# Altium project Servo-Board-v1.0.PrjPcb (part 9 of 23)

## Sheet Sec_Controller_Sheet4.SchDoc
size 420 x 297 mm; SheetNumber: 23; SheetTotal: 26
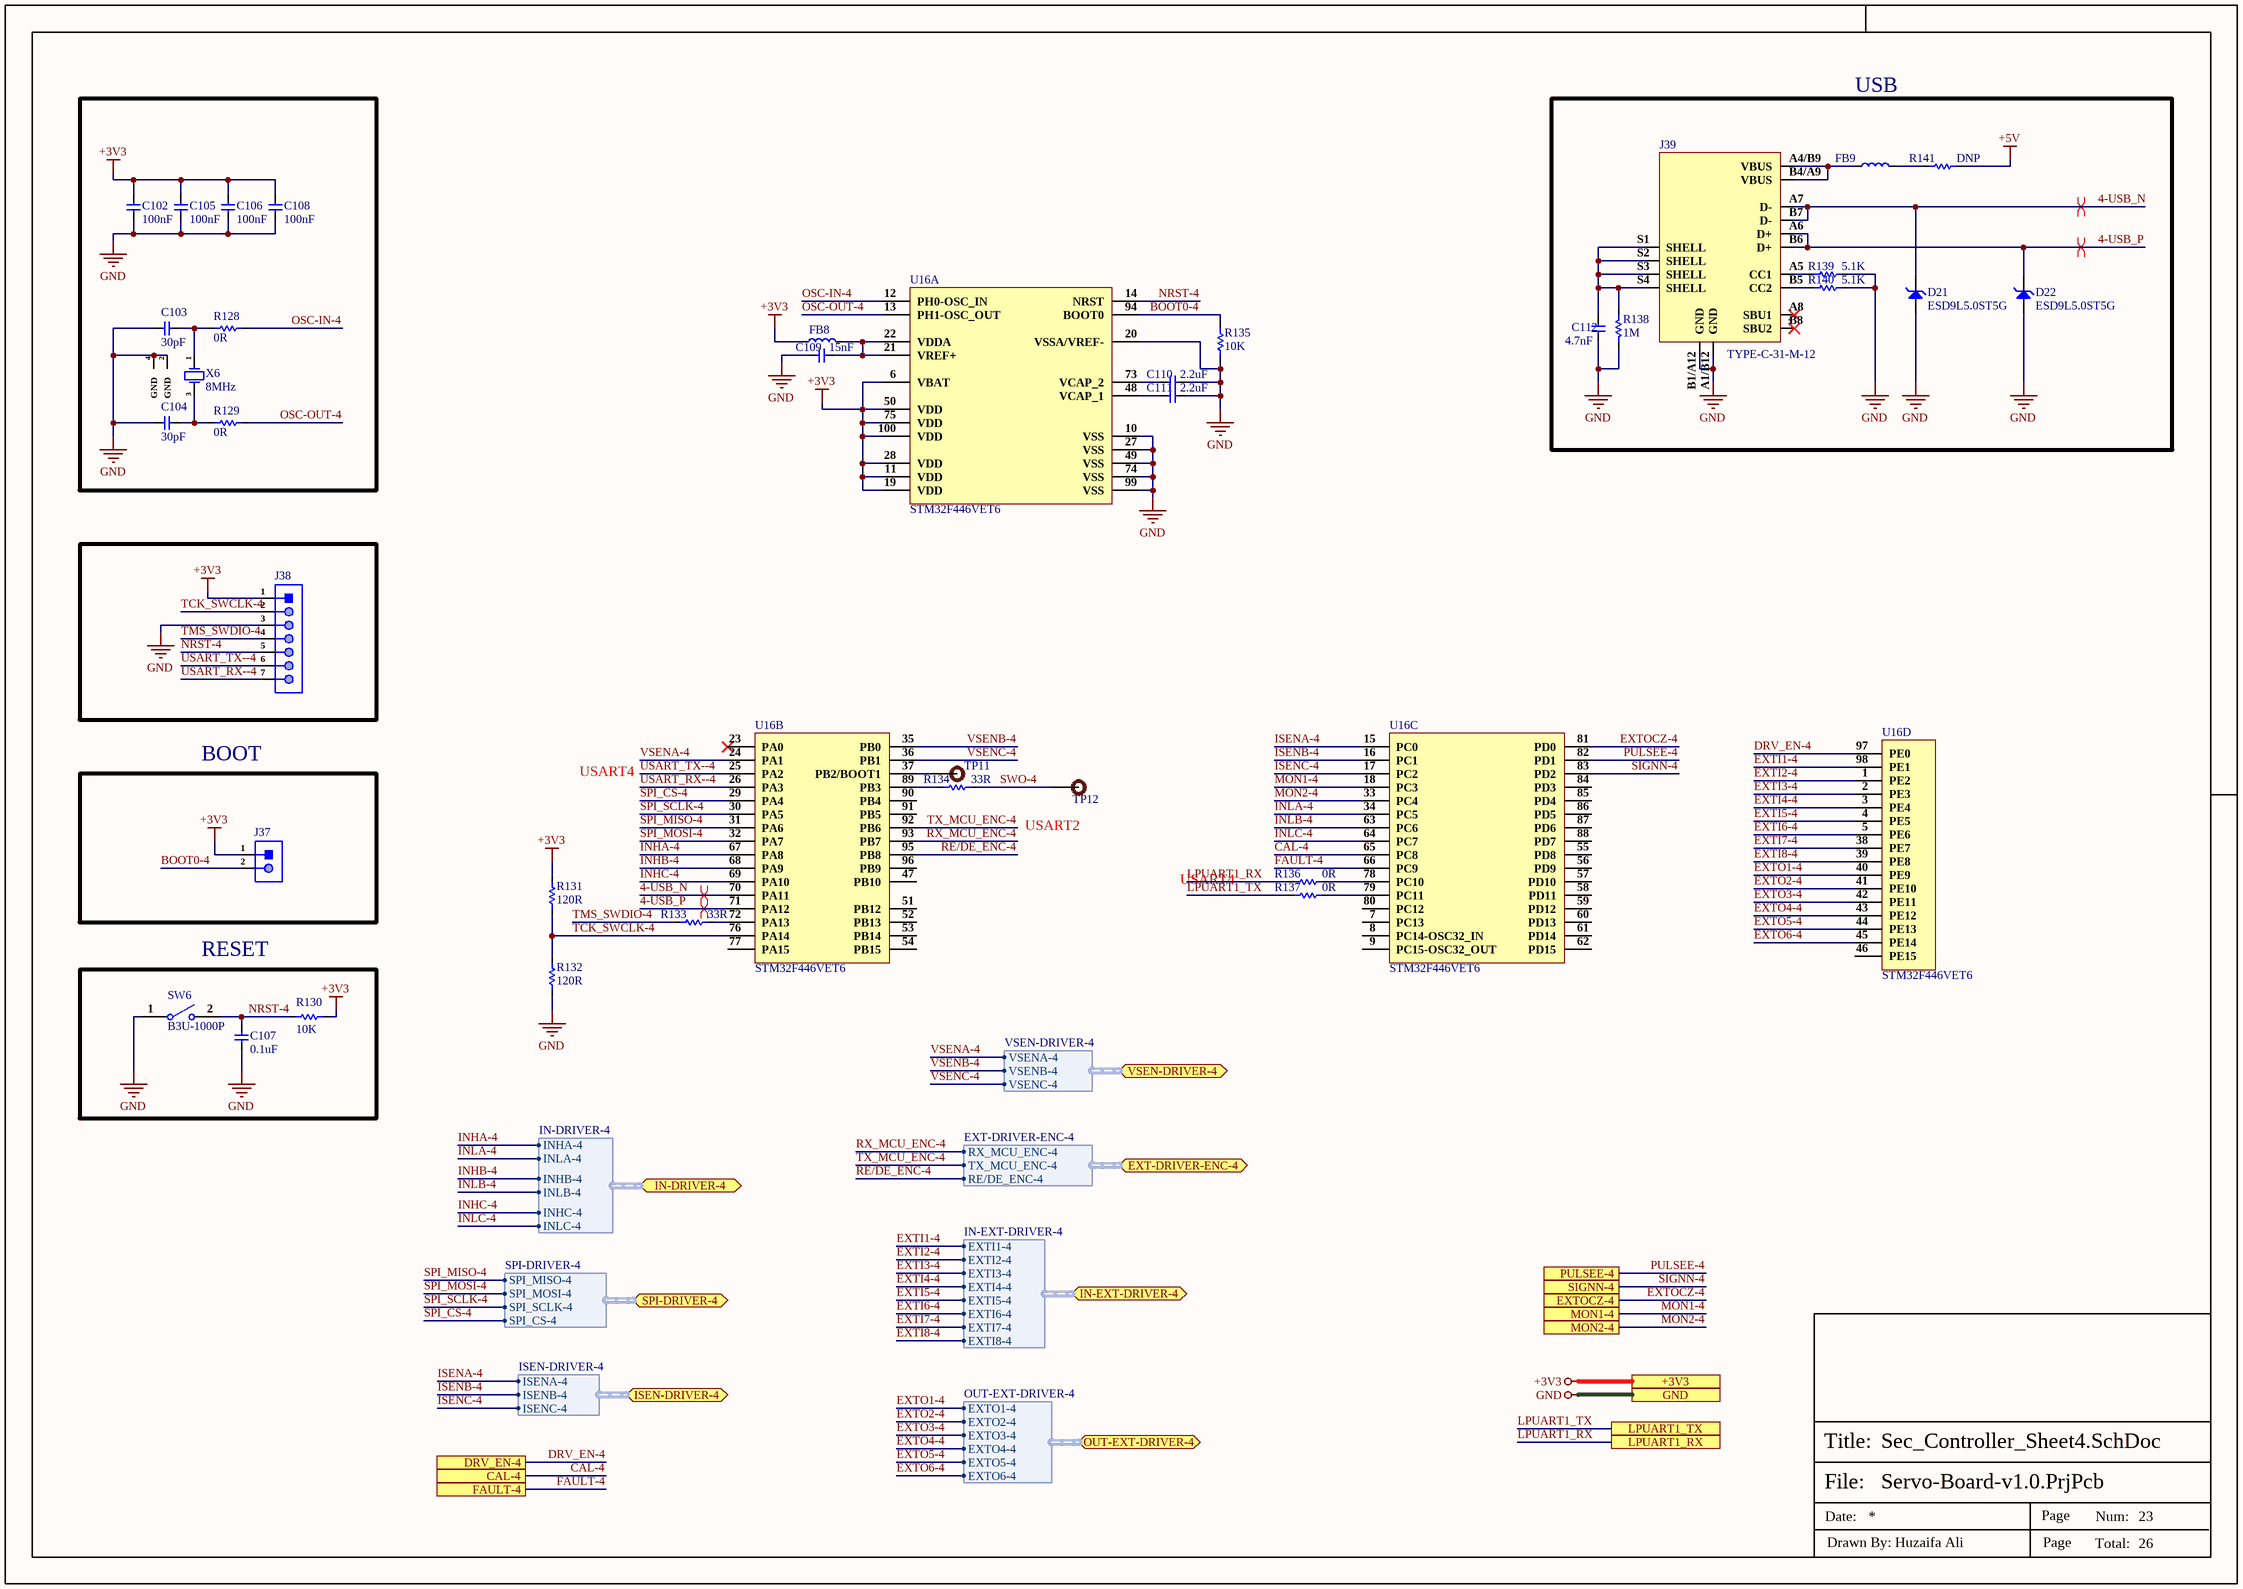
[diagram p11: Sec_Controller_Sheet4.SchDoc]

### Parts
C102  100nF  [cap-0402]
C103  30pF  [Cap-0402]
C104  30pF  [Cap-0402]
C105  100nF  [cap-0402]
C106  100nF  [cap-0402]
C107  0.1uF  [Cap-0402]
C108  100nF  [cap-0402]
C109  15nF  [Cap-0402]
C110  2.2uF  [Cap-0402]
C111  2.2uF  [Cap-0402]
C112  4.7nF  [Cap-0603]
D21  ESD9L5.0ST5G  [SOD-923.]
D22  ESD9L5.0ST5G  [SOD-923.]
FB8  BLM18PG221SN1D  [IND-0603 (1608 Metric)]  (value not drawn)
FB9  BLM18PG221SN1D  [IND-0603 (1608 Metric)]  (value not drawn)
J37  X6511WV-02H-C60D30  [HDR1X2_]  (value not drawn)
J38  X6511WV-07H-C60D30  [HDR1X7]  (value not drawn)
J39  TYPE-C-31-M-12  [TYPE-C-31-M-12_]
R128  0R  [Res-0603]
R129  0R  [Res-0603]
R130  10K  [Res-0402]
R131  120R  [Res-0402]
R132  120R  [Res-0402]
R133  33R  [Res-0402]
R134  33R  [Res-0402]
R135  10K  [Res-0402]
R136  0R  [Res-0402]
R137  0R  [Res-0402]
R138  1M  [Res-0402]
R139  5.1K  [Res-0402]
R140  5.1K  [Res-0402]
R141  DNP  [Res-0402]
SW6  B3U-1000P  [B3U-1000P]
TP11  TEST POINT 0.5mm Dia  [Test-point - 0.5mm]  (value not drawn)  (no BOM)
TP12  TEST POINT 0.5mm Dia  [Test-point - 0.5mm]  (value not drawn)  (no BOM)
U16  STM32F446VET6  [LQFP-100]  (parts A,B,C,D of 4)
X6  8MHz  [5TJ480000XYLBC_]

### Blocks framed on the sheet
USB: C112 D21 D22 FB9 J39 R138-R141
BOOT: J37
RESET: C107 R130 SW6

### Ports
+3V3 (see Servo4[3A], CAN_Sheet[4D], Controller_Sheet[5D], DIO_1[5D], DIO_2[5D], DIO_3[5D], DIO_4[5D], Encoder_Sheet1[5D], Encoder_Sheet2[4D], Encoder_Sheet3[4D], Encoder_Sheet4[5D], EtherCAT_Sheet[5D], Motor_Driver_Sheet1[5D], Motor_Driver_Sheet2[5D], Motor_Driver_Sheet3[5D], Motor_Driver_Sheet4[5D], Power_Sheet[5D], RS485_RS232_Sheet[5D], Sec_Controller_Sheet1[5D], Sec_Controller_Sheet2[5D], Sec_Controller_Sheet3[5D], Servo1[5D], Servo2[5D], Servo3[5D], Servo4[5D]), CAL-4 (see Servo4[3B], Motor_Driver_Sheet4[1D]), DRV_EN-4 (see Servo4[3B], Motor_Driver_Sheet4[1D]), EXT-DRIVER-ENC-4 (bidir, harness EXT-DRIVER-ENC-4, see Servo4[4B], Encoder_Sheet4[3D]), EXTOCZ-4 (see Servo4[4B], DIO_4[3D]), FAULT-4 (see Servo4[3B], Motor_Driver_Sheet4[1D]), GND (see Servo4[3B], CAN_Sheet[4D], Controller_Sheet[5D], DIO_1[5D], DIO_2[5D], DIO_3[5D], DIO_4[5D], Encoder_Sheet1[5D], Encoder_Sheet2[4D], Encoder_Sheet3[4D], Encoder_Sheet4[5D], EtherCAT_Sheet[5D], Motor_Driver_Sheet1[5D], Motor_Driver_Sheet2[5D], Motor_Driver_Sheet3[5D], Motor_Driver_Sheet4[5D], Power_Sheet[5D], RS485_RS232_Sheet[5D], Sec_Controller_Sheet1[5D], Sec_Controller_Sheet2[5D], Sec_Controller_Sheet3[5D], Servo1[5D], Servo2[5D], Servo3[5D], Servo4[5D]), IN-DRIVER-4 (bidir, harness IN-DRIVER-4, see Servo4[3B], Motor_Driver_Sheet4[1D]), IN-EXT-DRIVER-4 (bidir, harness IN-EXT-DRIVER-4, see Servo4[4B], DIO_4[1D]), ISEN-DRIVER-4 (bidir, harness ISEN-DRIVER-4, see Servo4[3B], Motor_Driver_Sheet4[3D]), LPUART1_RX (see Servo4[3B], Controller_Sheet[4D], Servo4[3B]), LPUART1_TX (see Servo4[3B], Controller_Sheet[4D], Servo4[3B]), MON1-4 (see Servo4[4B], DIO_4[3D]), MON2-4 (see Servo4[4B], DIO_4[3D]), OUT-EXT-DRIVER-4 (bidir, harness OUT-EXT-DRIVER-4, see Servo4[4B], DIO_4[2D]), PULSEE-4 (see Servo4[4B], DIO_4[3D]), SIGNN-4 (see Servo4[4B], DIO_4[3D]), SPI-DRIVER-4 (bidir, harness SPI-DRIVER-4, see Servo4[3B], Motor_Driver_Sheet4[2D]), VSEN-DRIVER-4 (bidir, harness VSEN-DRIVER-4, see Servo4[3B], Motor_Driver_Sheet4[4D])

### Harnesses
IN-DRIVER-4: INHA-4, INLA-4, INHB-4, INLB-4, INHC-4, INLC-4
SPI-DRIVER-4: SPI_MISO-4, SPI_MOSI-4, SPI_SCLK-4, SPI_CS-4
ISEN-DRIVER-4: ISENA-4, ISENB-4, ISENC-4
EXT-DRIVER-ENC-4: RX_MCU_ENC-4, TX_MCU_ENC-4, RE/DE_ENC-4
IN-EXT-DRIVER-4: EXTI1-4, EXTI2-4, EXTI3-4, EXTI4-4, EXTI5-4, EXTI6-4, EXTI7-4, EXTI8-4
OUT-EXT-DRIVER-4: EXTO1-4, EXTO2-4, EXTO3-4, EXTO4-4, EXTO5-4, EXTO6-4
VSEN-DRIVER-4: VSENA-4, VSENB-4, VSENC-4

### Nets
+3V3: C102.2 C105.2 C106.2 C108.2 FB8.1 J37.1 J38.1 R130.2 R131.2 U16.6(VBAT) U16.11(VDD) U16.19(VDD) U16.28(VDD) U16.50(VDD) U16.75(VDD) U16.100(VDD) ; port +3V3
+5V: R141.2
GND: C102.1 C103.1 C104.1 C105.1 C106.1 C107.1 C108.1 C109.1 C110.2 C111.2 C112.1 D21.2(A) D22.2(A) J38.3 J39.A1/B12(GND) J39.B1/A12(GND) R132.1 R135.1 R138.2 R139.2 R140.2 SW6.1 U16.10(VSS) U16.20(VSSA/VREF-) U16.27(VSS) U16.49(VSS) U16.74(VSS) U16.99(VSS) X6.2(GND) X6.4(GND) ; port GND
4-USB_N: D21.1(K) J39.A7(D-) J39.B7(D-) U16.70(PA11)
4-USB_P: D22.1(K) J39.A6(D+) J39.B6(D+) U16.71(PA12)
BOOT0-4: J37.2 R135.2 U16.94(BOOT0)
CAL-4: U16.65(PC8) ; port CAL-4
DRV_EN-4: U16.97(PE0) ; port DRV_EN-4
EXTI1-4: U16.98(PE1) ; port IN-EXT-DRIVER-4.EXTI1-4
EXTI2-4: U16.1(PE2) ; port IN-EXT-DRIVER-4.EXTI2-4
EXTI3-4: U16.2(PE3) ; port IN-EXT-DRIVER-4.EXTI3-4
EXTI4-4: U16.3(PE4) ; port IN-EXT-DRIVER-4.EXTI4-4
EXTI5-4: U16.4(PE5) ; port IN-EXT-DRIVER-4.EXTI5-4
EXTI6-4: U16.5(PE6) ; port IN-EXT-DRIVER-4.EXTI6-4
EXTI7-4: U16.38(PE7) ; port IN-EXT-DRIVER-4.EXTI7-4
EXTI8-4: U16.39(PE8) ; port IN-EXT-DRIVER-4.EXTI8-4
EXTO1-4: U16.40(PE9) ; port OUT-EXT-DRIVER-4.EXTO1-4
EXTO2-4: U16.41(PE10) ; port OUT-EXT-DRIVER-4.EXTO2-4
EXTO3-4: U16.42(PE11) ; port OUT-EXT-DRIVER-4.EXTO3-4
EXTO4-4: U16.43(PE12) ; port OUT-EXT-DRIVER-4.EXTO4-4
EXTO5-4: U16.44(PE13) ; port OUT-EXT-DRIVER-4.EXTO5-4
EXTO6-4: U16.45(PE14) ; port OUT-EXT-DRIVER-4.EXTO6-4
EXTOCZ-4: U16.81(PD0) ; port EXTOCZ-4
FAULT-4: U16.66(PC9) ; port FAULT-4
INHA-4: U16.67(PA8) ; port IN-DRIVER-4.INHA-4
INHB-4: U16.68(PA9) ; port IN-DRIVER-4.INHB-4
INHC-4: U16.69(PA10) ; port IN-DRIVER-4.INHC-4
INLA-4: U16.34(PC5) ; port IN-DRIVER-4.INLA-4
INLB-4: U16.63(PC6) ; port IN-DRIVER-4.INLB-4
INLC-4: U16.64(PC7) ; port IN-DRIVER-4.INLC-4
ISENA-4: U16.15(PC0) ; port ISEN-DRIVER-4.ISENA-4
ISENB-4: U16.16(PC1) ; port ISEN-DRIVER-4.ISENB-4
ISENC-4: U16.17(PC2) ; port ISEN-DRIVER-4.ISENC-4
LPUART1_RX: R136.1 ; port LPUART1_RX
LPUART1_TX: R137.1 ; port LPUART1_TX
MON1-4: U16.18(PC3) ; port MON1-4
MON2-4: U16.33(PC4) ; port MON2-4
NRST-4: C107.2 J38.5 R130.1 SW6.2 U16.14(NRST)
OSC-IN-4: R128.2 U16.12(PH0-OSC_IN)
OSC-OUT-4: R129.2 U16.13(PH1-OSC_OUT)
PULSEE-4: U16.82(PD1) ; port PULSEE-4
RE/DE_ENC-4: U16.95(PB8) ; port EXT-DRIVER-ENC-4.RE/DE_ENC-4
RX_MCU_ENC-4: U16.93(PB7) ; port EXT-DRIVER-ENC-4.RX_MCU_ENC-4
SIGNN-4: U16.83(PD2) ; port SIGNN-4
SPI_CS-4: U16.29(PA4) ; port SPI-DRIVER-4.SPI_CS-4
SPI_MISO-4: U16.31(PA6) ; port SPI-DRIVER-4.SPI_MISO-4
SPI_MOSI-4: U16.32(PA7) ; port SPI-DRIVER-4.SPI_MOSI-4
SPI_SCLK-4: U16.30(PA5) ; port SPI-DRIVER-4.SPI_SCLK-4
SWO-4: R134.2 TP12.1
TCK_SWCLK-4: J38.2 R131.1 R132.2 U16.76(PA14)
TMS_SWDIO-4: J38.4 R133.1
TX_MCU_ENC-4: U16.92(PB6) ; port EXT-DRIVER-ENC-4.TX_MCU_ENC-4
USART_RX--4: J38.7 U16.26(PA3)
USART_TX--4: J38.6 U16.25(PA2)
VSENA-4: U16.24(PA1) ; port VSEN-DRIVER-4.VSENA-4
VSENB-4: U16.35(PB0) ; port VSEN-DRIVER-4.VSENB-4
VSENC-4: U16.36(PB1) ; port VSEN-DRIVER-4.VSENC-4
NetC103_2: C103.2 R128.1 X6.1(OSC1)
NetC104_2: C104.2 R129.1 X6.3(OSC2)
NetC109_2: C109.2 FB8.2 U16.21(VREF+) U16.22(VDDA)
NetC110_1: C110.1 U16.73(VCAP_2)
NetC111_1: C111.1 U16.48(VCAP_1)
NetC112_2: C112.2 J39.S1(SHELL) J39.S2(SHELL) J39.S3(SHELL) J39.S4(SHELL) R138.1
NetFB9_1: FB9.1 J39.A4/B9(VBUS) J39.B4/A9(VBUS)
NetFB9_2: FB9.2 R141.1
NetJ39_A5: J39.A5(CC1) R139.1
NetJ39_B5: J39.B5(CC2) R140.1
NetR133_2: R133.2 U16.72(PA13)
NetR134_1: R134.1 U16.89(PB3)
NetR136_2: R136.2 U16.78(PC10)
NetR137_2: R137.2 U16.79(PC11)
NetTP11_1: TP11.1 U16.37(PB2/BOOT1)

Not connected (* = marked no-connect by the designer): J39 A8(SBU1)* B8(SBU2)*; U16 7(PC13) 8(PC14-OSC32_IN) 9(PC15-OSC32_OUT) 23(PA0)* 46(PE15) 47(PB10) 51(PB12) 52(PB13) 53(PB14) 54(PB15) 55(PD8) 56(PD9) 57(PD10) 58(PD11) 59(PD12) 60(PD13) 61(PD14) 62(PD15) 77(PA15) 80(PC12) 84(PD3) 85(PD4) 86(PD5) 87(PD6) 88(PD7) 90(PB4) 91(PB5) 96(PB9)

### Layout directives
differential pair; net class USB_PROGRAM; differential pair class USB_PROGRAM_LINES; rule Impedance Constraint [Min = 85.00    Max = 90.00    ]; rule Matched Net Lengths [Tolerance = 50mil]: 4-USB_N, 4-USB_P

### Notes on the sheet
- USART4
- (near TP12) USART2
- File:
- Title:
- Date:
- Page
- Num:
- Total:
- Drawn By: Huzaifa Ali

### Library data of the parts
C102 C105 C106 C108 = C1005X7R1H104KT000F: CAP CER 0.1UF 50V X7R 0402; Manufacturer: TDK; Tolerance: 10%; Voltage: 25V; Item Type: Capacitor; Supplier 1: Avnet; Manufacturer Part Number: C1005X7R1H104KT000F; RoHS: No; Category: Ceramic Capacitors; Dielectric: X7R; Supplier Part Number 1: C1005X7R1H104KT000F; LCSC Part Number: C361198; ComponentLink1Description: LCSC; ComponentLink1URL: https://www.lcsc.com/product-detail/Multilayer-Ceramic-Capacitors-MLCC-SMD-SMT_TDK-C1005X7R1H104KT000F_C361198.html
C103 C104 = CC0402GRNPO9BN300: CAP CER 30PF 50V C0G/NPO 0402; Manufacturer: Yageo; Item Type: Capacitor; Tolerance: 2%; Dielectric: C0G; Supplier: Digikey; LCSC Part Number: C277479; Manufacturer Part Number: CC0402GRNPO9BN300; RoHS: Yes; Stock: 114930; Pricing: 1=0.1, 10=0.052, 50=0.0296, 100=0.023, 500=0.01728, 1000=0.01358, 2500=0.01235, 5000=0.01136 (USD); Mounting Technology: Surface Mount; Case/Package: 0402; Case Code (Imperial): 0402; Case Code (Metric): 1005; Weight: 2.3E-05oz; Min Operating Temperature: -55°C; Max Operating Temperature: 125°C; Value: 30pF; Voltage Rating (DC): 50V; Packaging: Tape and Reel; Termination: SMD/SMT; Voltage Rating: 50V; Series: CC; Length: 0.039inch; Width: 0.02inch; Thickness: 0.022inch; Halogen Free: 5694HalogenFree; Lead Free: 5697LeadFree; ComponentLink1URL: https://datasheet.ciiva.com/13263/upy-gp-np0-16v-to-50v-8-3714-13263350.pdf?src-supplier=Mouser; ComponentLink1Description: https://datasheet.ciiva.com/13263/upy-gp-np0-16v-to-50v-8-3714-13263350.pdf?src-supplier=Mouser
C107 = CC0402JRX7R7BB104: CAP CER 0.1UF 16V X7R 0402; Manufacturer: Yageo; Material: 4241ConductorMaterial; Value: 100nF; Tolerance: 5%; Item Type: Capacitor; Supplier: Digikey; Supplier Part Number: 311-1676-1-ND; Manufacturer Part Number: CC0402JRX7R7BB104; RoHS: Yes; Category: Ceramic Capacitors; Stock: 1659111; Pricing: 1=0.1, 10=0.046, 50=0.0262, 100=0.0203, 500=0.01528, 1000=0.012, 2500=0.01091, 5000=0.01004 (USD); Mounting Technology: Surface Mount; Case/Package: 0402; Case Code (Metric): 1005; Case Code (Imperial): 0402; Min Operating Temperature: -55°C; Max Operating Temperature: 125°C; Dielectric: X7R; Packaging: Tape and Reel; Package Quantity: 10000; Voltage Rating (DC): 16V; Voltage Rating: 16V; Series: CC; Construction: Flat; Length: 0.039inch; Width: 0.02inch; Height: 0.5mm; Thickness: 0.022inch; Lead Free: Lead Free; Halogen Free: Halogen Free; RoHS Compliant: Yes; ComponentLink1URL: https://datasheet.ciiva.com/13210/upy-gphc-x7r-6-3v-to-50v-8-12304-13210152.pdf?src-supplier=Mouser; ComponentLink1Description: https://datasheet.ciiva.com/13210/upy-gphc-x7r-6-3v-to-50v-8-12304-13210152.pdf?src-supplier=Mouser; LCSC Part Number: C541464
C109 = CC0402JRX7R7BB153: CAP CER 0.015UF 16V X7R 0402; Manufacturer: Yageo; Tolerance: 5%; Item Type: Capacitor; Supplier: Digikey; Supplier Part Number: 13-CC0402JRX7R7BB153CT-ND; Manufacturer Part Number: CC0402JRX7R7BB153; RoHS: Yes; Category: Ceramic Capacitors; Stock: 24539; Pricing: 1=0.1, 10=0.045, 50=0.0258, 100=0.0201, 500=0.0151, 1000=0.01186, 2500=0.01078, 5000=0.00992 (USD); Mounting Technology: Surface Mount; Case/Package: 0402; Case Code (Imperial): 0402; Case Code (Metric): 1005; Weight: 2.3E-05oz; Min Operating Temperature: -55°C; Max Operating Temperature: 125°C; Value: 15nF; Voltage Rating (DC): 16V; Packaging: Tape and Reel; Dielectric: X7R; Voltage Rating: 16V; Termination: SMD/SMT; Series: CC; Length: 0.039inch; Width: 0.02inch; Thickness: 0.022inch; Lead Free: Lead Free; Halogen Free: Halogen Free; RoHS Compliant: Yes; ComponentLink1URL: https://datasheet.ciiva.com/13263/upy-gphc-x7r-6-3v-to-50v-8-12304-13263342.pdf?src-supplier=Mouser; ComponentLink1Description: https://datasheet.ciiva.com/13263/upy-gphc-x7r-6-3v-to-50v-8-12304-13263342.pdf?src-supplier=Mouser; LCSC Part Number: C527002
C110 C111 = C1005X5R0J225KTJA0E: CAP CER 2.2UF 6.3V X5R 0402; Manufacturer: TDK; Item Type: Capacitor; LCSC Part Number: C343036; Manufacturer Part Number: C1005X5R0J225KTJA0E; ComponentLink1Description: LCSC; ComponentLink1URL: https://www.lcsc.com/product-detail/Multilayer-Ceramic-Capacitors-MLCC-SMD-SMT_TDK-C1005X5R0J225KTJA0E_C343036.html
C112 = CC0603JRNPO9BN472: CAP CER 4700PF 50V C0G/NPO 0603; Manufacturer: Yageo; Item Type: Capacitor; Supplier 1: Digi-Key; Manufacturer Part Number: CC0603JRNPO9BN472; RoHS: Yes; Category: Ceramic Capacitors; Stock 1: 31779; Pricing 1: 1=0.48000, 10=0.33000, 50=0.23100, 100=0.19800, 500=0.14854, 1000=0.12543 (USD); RoHS Compliant: Yes; Supplier Part Number 1: 13-CC0603JRNPO9BN472CT-ND; LCSC Part Number: C576818; ComponentLink1Description: LCSC; ComponentLink1URL: https://www.lcsc.com/product-detail/Multilayer-Ceramic-Capacitors-MLCC-SMD-SMT_YAGEO-CC0603JRNPO9BN472_C576818.html
D21 D22 = ESD9L5.0ST5G: TVS DIODE 5V 9.8V SOD923; Manufacturer: ON Semiconductor; Capacitance: 0.9pF; Direction: Unidirectional; Number of Unidirectional Channels: 1; Min Breakdown Voltage: 5.4V; Power Line Protection: No; Leakage Current: 1uA; Element Configuration: Single; Peak Pulse Current: 1A; Diode Type: ZENER; Reverse Breakdown Voltage: 5.8V; Peak Pulse Power: 150mW; ESD Protection: Yes; Test Current: 1mA; Supplier 1: Digi-Key; Manufacturer Part Number: ESD9L5.0ST5G; RoHS: Yes; Category: ESD and Circuit Protection ICs; Stock 1: 558996; Pricing 1: 1=0.37000, 10=0.25600, 100=0.12500, 500=0.10426, 1000=0.07244, 2000=0.06278 (USD); Case/Package: SOD-923-2; Number of Pins: 2; Contact Plating: Tin,Matte; Min Operating Temperature: -55°C; Max Operating Temperature: 150°C; Package Quantity: 1; Packaging: Tape and Reel; Clamping Voltage: 9.8V; Reverse Standoff Voltage: 5V; Working Voltage: 5V; Resistor Type: Zener; Series: Automotive, AEC-Q101; Number of Elements: 1; Operating Supply Voltage: 5V; Max Surge Current: 1A; Breakdown Voltage: 5.4V; Number of Channels: 1; Polarity: Unidirectional; Termination: SMD/SMT; Max Reverse Leakage Current: 1uA; Max Breakdown Voltage: 5.4V; Number of Lines: 1; Power Dissipation: 150mW; Clamping Voltage-Max: 9.8V; Length: 0.8mm; Width: 0.65mm; Height: 0.4mm; Depth: 0.6mm; Radiation Hardening: No; Lead Free: Lead Free; RoHS Compliant: Yes; REACH SVHC: No SVHC; Halogen Free: Halogen Free; ComponentLink1URL: https://datasheet.ciiva.com/15143/getdatasheetpartid-185186-15143896.pdf?src-supplier=Verical; ComponentLink1Description: https://datasheet.ciiva.com/15143/getdatasheetpartid-185186-15143896.pdf?src-supplier=Verical; ComponentLink2URL: https://datasheet.ciiva.com/4510/esd9l-d-4510647.pdf?src-supplier=Mouser; ComponentLink2Description: https://datasheet.ciiva.com/4510/esd9l-d-4510647.pdf?src-supplier=Mouser; ComponentLink3URL: https://datasheet.ciiva.com/3304/esd9l-d-3304011.pdf?src-supplier=Avnet; ComponentLink3Description: https://datasheet.ciiva.com/3304/esd9l-d-3304011.pdf?src-supplier=Avnet; ComponentLink4URL: https://datasheet.ciiva.com/16437/esd9l-d-16437835.pdf?src-supplier=Future+Electronics; ComponentLink4Description: https://datasheet.ciiva.com/16437/esd9l-d-16437835.pdf?src-supplier=Future+Electronics; ComponentLink5URL: https://datasheet.ciiva.com/339/esd9l-d-339853.pdf?src-supplier=Digi-Key; ComponentLink5Description: https://datasheet.ciiva.com/339/esd9l-d-339853.pdf?src-supplier=Digi-Key; ComponentLink6URL: https://datasheet.ciiva.com/339/esd9l-d-339854.pdf?src-supplier=Digi-Key; ComponentLink6Description: https://datasheet.ciiva.com/339/esd9l-d-339854.pdf?src-supplier=Digi-Key; ComponentLink7URL: https://datasheet.ciiva.com/11195/esd9l-d-11195342.pdf?src-supplier=Avnet; ComponentLink7Description: https://datasheet.ciiva.com/11195/esd9l-d-11195342.pdf?src-supplier=Avnet; ComponentLink8URL: https://datasheet.ciiva.com/25958/esd9l-d-25958446.pdf?src-supplier=Avnet+Europe; ComponentLink8Description: https://datasheet.ciiva.com/25958/esd9l-d-25958446.pdf?src-supplier=Avnet+Europe; ComponentLink9URL: https://datasheet.ciiva.com/339/esd9l-d-339855.pdf?src-supplier=Digi-Key; ComponentLink9Description: https://datasheet.ciiva.com/339/esd9l-d-339855.pdf?src-supplier=Digi-Key; Supplier Part Number 1: ESD9L5.0ST5GOSCT-ND; LCSC Part Number: C82326
FB8 FB9 = BLM18PG221SN1D: FERRITE BEAD 220 OHM 0603 1LN; Manufacturer: Murata; Manufacturer Series: BLM18P; Material: Steel,Ferrite; Value: 100mR; Impedance: 220R; Tolerance: 25%; Current Rating: 1.4A; Number of Lines: 1; Test Frequency: 100MHz; Shielding: Unshielded; Supplier: Digikey; LCSC Part Number: C80165; Manufacturer Part Number: BLM18PG221SN1D; RoHS: Yes; Item Type: Ferrite Bead; Stock: 134052; Pricing: 1=0.1, 10=0.078, 25=0.0712, 50=0.064, 100=0.0469, 250=0.03412, 500=0.03128, 1000=0.02701 (USD); Case/Package: 0603; Pins: 2; Core Material: Ferrite; Case Code (Metric): 1608; Case Code (Imperial): 0603; Weight: 7.1E-05oz; Min Operating Temperature: -55°C; Max Operating Temperature: 125°C; Package Quantity: 1; Packaging: Tape and Reel; ESR (Equivalent Series Resistance): 220R; Max Current Rating: 1.4A; DC Resistance (DCR): 100mR; Termination: SMD/SMT; Max DC Current: 1.4A; DC Current: 1.4A; Number of Circuits: 1; Series: BLM18P; Channels: 1; DC Resistance-Max: 100mR; RMS Current (Irms): 1.4A; ESR: 100mR; Length: 1.6mm; Width: 0.8mm; Height: 0.8mm; Depth: 0.8mm; Radiation Hardening: No; Reach SVHC Compliant: No; Lead Free: Lead Free; RoHS Compliant: Yes; ComponentLink1URL: https://datasheet.ciiva.com/19458/1845030-19458417.pdf?src-supplier=Jameco; ComponentLink1Description: https://datasheet.ciiva.com/19458/1845030-19458417.pdf?src-supplier=Jameco; ComponentLink2URL: https://datasheet.ciiva.com/11800/0900766b81275ca5-11800851.pdf?src-supplier=Rs; ComponentLink2Description: https://datasheet.ciiva.com/11800/0900766b81275ca5-11800851.pdf?src-supplier=Rs; ComponentLink3URL: https://datasheet.ciiva.com/29347/442391-da-01-en-chip-drossel-0603-220r-1400ma-1-6x0-8mm-29347986.pdf?src-supplier=Conrad; ComponentLink3Description: https://datasheet.ciiva.com/29347/442391-da-01-en-chip-drossel-0603-220r-1400ma-1-6x0-8mm-29347986.pdf?src-supplier=Conrad; ComponentLink4URL: https://datasheet.ciiva.com/8021/5148-8021482.pdf?src-supplier=Element14; ComponentLink4Description: https://datasheet.ciiva.com/8021/5148-8021482.pdf?src-supplier=Element14; ComponentLink5URL: https://datasheet.ciiva.com/8021/5148-8021479.pdf?src-supplier=Element14; ComponentLink5Description: https://datasheet.ciiva.com/8021/5148-8021479.pdf?src-supplier=Element14; ComponentLink6URL: https://datasheet.ciiva.com/14122/blm-series-eng-tds-14122909.pdf?src-supplier=Distrelec; ComponentLink6Description: https://datasheet.ciiva.com/14122/blm-series-eng-tds-14122909.pdf?src-supplier=Distrelec; ComponentLink7URL: https://datasheet.ciiva.com/1012/l0110s0100blm18p-1012162.pdf?src-supplier=Digikey; ComponentLink7Description: https://datasheet.ciiva.com/1012/l0110s0100blm18p-1012162.pdf?src-supplier=Digikey; ComponentLink8URL: https://datasheet.ciiva.com/1012/l0110s0100blm18p-1012161.pdf?src-supplier=Digikey; ComponentLink8Description: https://datasheet.ciiva.com/1012/l0110s0100blm18p-1012161.pdf?src-supplier=Digikey; ComponentLink9URL: https://datasheet.ciiva.com/1012/l0110s0100blm18p-1012163.pdf?src-supplier=Digikey; ComponentLink9Description: https://datasheet.ciiva.com/1012/l0110s0100blm18p-1012163.pdf?src-supplier=Digikey; ComponentLink10URL: https://datasheet.ciiva.com/3081/l0110s0100blm18p-3081633.pdf?src-supplier=Avnet; ComponentLink10Description: https://datasheet.ciiva.com/3081/l0110s0100blm18p-3081633.pdf?src-supplier=Avnet; ComponentLink11URL: https://datasheet.ciiva.com/16205/l0110s0100blm18p-16205422.pdf?src-supplier=Future+Electronics; ComponentLink11Description: https://datasheet.ciiva.com/16205/l0110s0100blm18p-16205422.pdf?src-supplier=Future+Electronics
J37 = X6511WV-02H-C60D30: Gold 250V 3A Straight Square Pins 2.5mm 2P 260℃ 6mm -40℃~+105℃ 3mm 2.54mm Plugin Black Brass 1x2P Plugin,P=2.54mm Pin Headers ROHS; Manufacturer: XKB; Item Type: Male Header; Manufacturer Part Number: X6511WV-02H-C60D30; Package: Plugin,P=2.54mm; LCSC Part Number: C706874; ComponentLink1Description: LCSC; ComponentLink1URL: https://www.lcsc.com/product-detail/Pin-Headers_XKB-Connectivity-X6511WV-02H-C60D30_C706874.html
J38 = X6511WV-07H-C60D30: Gold 250V 3A Straight Square Pins 2.5mm 7P 260℃ 6mm -40℃~+105℃ 3mm 2.54mm Plugin Black Brass 1x7P Plugin,P=2.54mm Pin Headers ROHS; Manufacturer: XKB; Item Type: Male Header; Manufacturer Part Number: X6511WV-07H-C60D30; Package: Plugin,P=2.54mm; LCSC Part Number: C706879; ComponentLink1Description: LCSC; ComponentLink1URL: https://www.lcsc.com/product-detail/Pin-Headers_XKB-Connectivity-X6511WV-07H-C60D30_C706879.html
J39 = TYPE-C-31-M-12: 5A 1 16P Female Type-C SMD USB Connectors ROHS; Manufacturer: Korean Hroparts Elec; ComponentLink1Description: LCSC; ComponentLink1URL: https://www.lcsc.com/product-detail/USB-Connectors_Korean-Hroparts-Elec-TYPE-C-31-M-12_C165948.html; Manufacturer Part Number: TYPE-C-31-M-12; Footprint: Custom; LCSC Part Number: C165948; Item Type: USB Connector
R128 R129 = RC0603JR-070RL: RES 0 OHM JUMPER 1/10W 0603; Manufacturer: Yageo; Resistance: 0mR; Tolerance: 1%; Power Rating: 100mW; Voltage Rating (DC): 50V; Temperature Coefficient: 200ppm/°C; Resistance Tolerance: 5%; Item Type: Resistor; Supplier 1: Digi-Key; Manufacturer Part Number: RC0603JR-070RL; RoHS: Yes; Category: Chip SMD Resistors; Stock 1: 18081776; Pricing 1: 1=0.10000, 10=0.01700, 25=0.01240, 50=0.00960, 100=0.00700, 250=0.00536, 500=0.00430, 1000=0.00316 (USD); Case/Package: 0603; Number of Pins: 2; Contact Plating: Tin,Matte; Case Code (Imperial): 0603; Case Code (Metric): 1608; Size Code: 0603; Min Operating Temperature: -55°C; Max Operating Temperature: 155°C; Resistor Type: Thick Film; Packaging: Tape and Reel; Termination: SMD/SMT; Series: RC; Technology: THICK FILM; Package Quantity: 5000; Voltage Rating: 50V; Features: Moisture Resistant; Max Power Dissipation: 100mW; Number of Terminations: 2; Construction: Rectangular; Length: 1.6mm; Width: 0.8mm; Height: 0.45mm; Depth: 0.8mm; Radiation Hardening: No; Reach SVHC Compliant: No SVHC; Lead Free: Lead Free; RoHS Compliant: Yes; Military Standard: Not; Supplier Part Number 1: 311-0.0GRCT-ND; LCSC Part Number: C95177
R130 R135 = RC0402FR-0710KL: RES 10K OHM 1% 1/16W 0402; Manufacturer: Yageo; Resistance: 10kR; Voltage Rating (DC): 50V; Temperature Coefficient: 100ppm/°C; Power Rating: 62.5mW; Max Power Dissipation: 63mW; Item Type: Resistor; Supplier 1: Mouser; Manufacturer Part Number: RC0402FR-0710KL; RoHS: Yes; Category: Chip SMD Resistors; Stock 1: 18648329; Pricing 1: 1=0.10000, 10=0.01400, 50=0.01400, 100=0.00500, 1000=0.00300, 10000=0.00200 (USD); Case/Package: 0402; Number of Pins: 2; Case Code (Imperial): 0402; Case Code (Metric): 1005; Min Operating Temperature: -55°C; Max Operating Temperature: 155°C; Resistor Type: Thick Film; Tolerance: 1%; Packaging: Tape and Reel; Voltage Rating: 50V; Termination: SMD/SMT; Working Voltage: 50V; Number of Terminations: 2; Features: Moisture Resistant; Series: RC; Resistance Tolerance: 1%; Construction: Rectangular; Length: 1mm; Width: 0.5mm; Height: 0.32mm; Depth: 0.5mm; Lead Pitch: 0.2mm; REACH SVHC: No SVHC; Lead Free: Lead Free; RoHS Compliant: Yes; Military Standard: Not; ComponentLink1URL: https://datasheet.ciiva.com/7660/38568-7660787.pdf?src-supplier=Element14; ComponentLink1Description: https://datasheet.ciiva.com/7660/38568-7660787.pdf?src-supplier=Element14; ComponentLink2URL: https://datasheet.ciiva.com/7849/1686128-7849814.pdf?src-supplier=Element14; ComponentLink2Description: https://datasheet.ciiva.com/7849/1686128-7849814.pdf?src-supplier=Element14; ComponentLink3URL: https://datasheet.ciiva.com/7983/1018594-7983486.pdf?src-supplier=Element14; ComponentLink3Description: https://datasheet.ciiva.com/7983/1018594-7983486.pdf?src-supplier=Element14; ComponentLink4URL: https://datasheet.ciiva.com/22747/1018594-22747512.pdf?src-supplier=Element14; ComponentLink4Description: https://datasheet.ciiva.com/22747/1018594-22747512.pdf?src-supplier=Element14; ComponentLink5URL: https://datasheet.ciiva.com/12667/pyu-rc0402-51-rohs-l-6-r-12667067.pdf?src-supplier=Mouser; ComponentLink5Description: https://datasheet.ciiva.com/12667/pyu-rc0402-51-rohs-l-6-r-12667067.pdf?src-supplier=Mouser; ComponentLink6URL: https://datasheet.ciiva.com/7849/1784430-7849813.pdf?src-supplier=Element14; ComponentLink6Description: https://datasheet.ciiva.com/7849/1784430-7849813.pdf?src-supplier=Element14; ComponentLink7URL: https://datasheet.ciiva.com/7849/1784430-7849815.pdf?src-supplier=Element14; ComponentLink7Description: https://datasheet.ciiva.com/7849/1784430-7849815.pdf?src-supplier=Element14; Supplier Part Number 1: 603-RC0402FR-0710KL; LCSC Part Number: C60490
R131 R132 = RC0402FR-07120RL: RES 120 OHM 1% 1/16W 0402; Manufacturer: Yageo; Item Type: Resistors; Power Rating: 62.5mW; Voltage Rating: 50V; Temperature Coefficient: 100ppm/°C; Max Power Dissipation: 63mW; Supplier: Future Electronics; Supplier Part Number: 4529079; Manufacturer Part Number: RC0402FR-07120RL; RoHS: Yes; Stock: 150000; Pricing: 10000=0.0012, 100000=0.0011, 300000=0.001, 750000=0.001, 2000000=0.0009 (USD); Case/Package: 0402; Case Code (Imperial): 0402; Case Code (Metric): 1005; Min Operating Temperature: -55°C; Max Operating Temperature: 155°C; Package Quantity: 1; Value: 120R; Tolerance: 1%; Packaging: Tape and Reel; Termination: SMD/SMT; Resistor Type: Thick Film; Number of Terminations: 2; Features: Moisture Resistant; Series: RC; Resistance Tolerance: 1%; Construction: Rectangular; Technology: THICK FILM; Voltage Rating (AC): 50V; Length: 0.039inch; Width: 0.02inch; Height: 0.016inch; Depth: 0.5mm; Reach SVHC Compliant: No; Military Standard: Not; RoHS Compliant: Yes; Lead Free: 5697LeadFree; ComponentLink1URL: https://datasheet.ciiva.com/12667/pyu-rc0402-51-rohs-l-6-r-12667958.pdf?src-supplier=Mouser; ComponentLink1Description: https://datasheet.ciiva.com/12667/pyu-rc0402-51-rohs-l-6-r-12667958.pdf?src-supplier=Mouser; ComponentLink2URL: https://datasheet.ciiva.com/7849/1018594-7849831.pdf?src-supplier=Element14; ComponentLink2Description: https://datasheet.ciiva.com/7849/1018594-7849831.pdf?src-supplier=Element14; LCSC Part Number: C114758
R133 R134 = RC0402FR-0733RL: RES 33 OHM 1% 1/16W 0402; Manufacturer: Yageo; Power Rating: 62.5mW; Voltage Rating: 50V; Temperature Coefficient: 100ppm/°C; Max Power Dissipation: 63mW; Supplier 1: Mouser; Manufacturer Part Number: RC0402FR-0733RL; RoHS: Yes; Category: Chip SMD Resistors; Stock 1: 1843488; Pricing 1: 1=0.10000, 10=0.01200, 50=0.01200, 100=0.00500, 1000=0.00300, 10000=0.00100 (USD); Case/Package: 0402; Number of Pins: 2; Case Code (Imperial): 0402; Case Code (Metric): 1005; Size Code: 0402; Min Operating Temperature: -55°C; Max Operating Temperature: 155°C; Resistor Type: Thick Film; Resistance: 33R; Tolerance: 1%; Packaging: Tape and Reel; Voltage Rating (DC): 50V; Package Quantity: 10000; Termination: SMD/SMT; Features: Moisture Resistant; Series: RC; Number of Terminations: 2; Resistance Tolerance: 1%; Construction: Rectangular; Technology: THICK FILM; Length: 1mm; Width: 0.5mm; Height: 0.35mm; Depth: 0.5mm; RoHS Compliant: Yes; REACH SVHC: Unknown; Military Standard: Not; Lead Free: Lead Free; ComponentLink1URL: https://datasheet.ciiva.com/11819/0900766b80c66297-11819487.pdf?src-supplier=RSComponents; ComponentLink1Description: https://datasheet.ciiva.com/11819/0900766b80c66297-11819487.pdf?src-supplier=RSComponents; ComponentLink2URL: https://datasheet.ciiva.com/24070/pyu-rc0402-51-rohs-l-6-r-8721-24070077.pdf?src-supplier=Mouser; ComponentLink2Description: https://datasheet.ciiva.com/24070/pyu-rc0402-51-rohs-l-6-r-8721-24070077.pdf?src-supplier=Mouser; ComponentLink3URL: https://datasheet.ciiva.com/7849/1018594-7849967.pdf?src-supplier=Element14; ComponentLink3Description: https://datasheet.ciiva.com/7849/1018594-7849967.pdf?src-supplier=Element14; ComponentLink4URL: https://datasheet.ciiva.com/7849/1018594-7849966.pdf?src-supplier=Element14; ComponentLink4Description: https://datasheet.ciiva.com/7849/1018594-7849966.pdf?src-supplier=Element14; ComponentLink5URL: https://datasheet.ciiva.com/15189/getdatasheetpartid-329253-15189431.pdf?src-supplier=Verical; ComponentLink5Description: https://datasheet.ciiva.com/15189/getdatasheetpartid-329253-15189431.pdf?src-supplier=Verical; ComponentLink6URL: https://datasheet.ciiva.com/17070/pyu-rc0402-51-rohs-l-6-r-17070335.pdf?src-supplier=Future+Electronics; ComponentLink6Description: https://datasheet.ciiva.com/17070/pyu-rc0402-51-rohs-l-6-r-17070335.pdf?src-supplier=Future+Electronics; Supplier Part Number 1: 603-RC0402FR-0733RL; LCSC Part Number: C138002
R136 R137 = RC0402FR-070RL: RES 0 OHM JUMPER 1/16W 0402; Manufacturer: Yageo; Item Type: Resistors; Tolerance: 1%; Power Rating: 62.5mW; Voltage Rating: 50V; Temperature Coefficient: 200ppm/°C; Max Power Dissipation: 63mW; Supplier 1: Mouser; Manufacturer Part Number: RC0402FR-070RL; RoHS: Yes; Stock 1: 8556842; Pricing 1: 1=0.10000, 10=0.01400, 50=0.01400, 100=0.00600, 1000=0.00300, 5000=0.00200, 10000=0.00100 (USD); Mount: Surface Mount; Case/Package: 0402; Contact Plating: Tin,Matte; Case Code (Imperial): 0402; Case Code (Metric): 1005; Size Code: 0402; Min Operating Temperature: -55°C; Max Operating Temperature: 155°C; Resistance: 0R; Resistor Type: Thick Film; Packaging: Tape and Reel; Termination: SMD/SMT; Features: Moisture Resistant; Series: RC; Number of Terminations: 2; Length: 1mm; Width: 0.5mm; Height: 0.35mm; Radiation Hardening: No; Lead Free: Lead Free; RoHS Compliant: Yes; ComponentLink1URL: https://datasheet.ciiva.com/8896/pyu-rc0402-51-rohs-l-6-8896149.pdf?src-supplier=Avnet; ComponentLink1Description: https://datasheet.ciiva.com/8896/pyu-rc0402-51-rohs-l-6-8896149.pdf?src-supplier=Avnet; ComponentLink2URL: https://datasheet.ciiva.com/16790/pyu-rc0402-51-rohs-l-6-r-16790444.pdf?src-supplier=Future+Electronics; ComponentLink2Description: https://datasheet.ciiva.com/16790/pyu-rc0402-51-rohs-l-6-r-16790444.pdf?src-supplier=Future+Electronics; Supplier Part Number 1: 603-RC0402FR-070RL; LCSC Part Number: C106231
R138 = AF0402JR-071ML: RES SMD 1M OHM 5% 1/16W 0402; Manufacturer: Yageo; Resistance: 1MR; Max Power Dissipation: 63mW; Temperature Coefficient: 100ppm/°C; Item Type: Resistor; Supplier 1: Digi-Key; Manufacturer Part Number: AF0402JR-071ML; Stock 1: 0; Pricing 1: 10000=0.00408 (USD); Case/Package: 0402; Min Operating Temperature: -55°C; Max Operating Temperature: 155°C; Packaging: Tape and Reel; Resistor Type: Thick Film; Number of Terminations: 2; Tolerance: 5%; Features: Moisture Resistant,Anti-Sulfur; Length: 0.039inch; Width: 0.02inch; Height: 0.015inch; RoHS Compliant: Yes; ComponentLink1URL: https://www.yageo.com/upload/media/product/productsearch/datasheet/rchip/PYu-AF_51_RoHS_L_6.pdf?src-supplier=Digi-Key; ComponentLink1Description: https://www.yageo.com/upload/media/product/productsearch/datasheet/rchip/PYu-AF_51_RoHS_L_6.pdf?src-supplier=Digi-Key; Supplier Part Number 1: AF0402JR-071ML-ND; LCSC Part Number: C144054
R139 R140 = RC0402FR-075K1L: RES 5.1K OHM 1% 1/16W 0402; Manufacturer: Yageo; Power Rating: 63mW; Resistance: 5.1kR; Temperature Coefficient: 100ppm/°C; Voltage Rating: 50V; Item Type: Resistor; Supplier 1: Avnet; Manufacturer Part Number: RC0402FR-075K1L; RoHS: Yes; Category: Chip SMD Resistors; Stock 1: 65000; Pricing 1: 10000=0.00085 (USD); Case/Package: 0402; Case Code (Metric): 1005; Case Code (Imperial): 0402; Min Operating Temperature: -55°C; Max Operating Temperature: 155°C; Tolerance: 1%; Technology: THICK FILM; Packaging: Tape and Reel; Package Quantity: 1; Resistor Type: Thick Film; Number of Terminations: 2; Termination: SMD/SMT; Max Power Dissipation: 63mW; Voltage Rating (DC): 50V; Working Voltage: 50V; Features: Moisture Resistant; Series: RC; Resistance Tolerance: 1%; Construction: Rectangular; Length: 1mm; Width: 0.02inch; Height: 0.016inch; Depth: 0.5mm; RoHS Compliant: Yes; Military Standard: Not; Lead Free: Lead Free; ComponentLink1URL: https://datasheet.ciiva.com/7983/1018594-7983519.pdf?src-supplier=Element14; ComponentLink1Description: https://datasheet.ciiva.com/7983/1018594-7983519.pdf?src-supplier=Element14; ComponentLink2URL: https://datasheet.ciiva.com/46394/1018594-46394936.pdf?src-supplier=Element14; ComponentLink2Description: https://datasheet.ciiva.com/46394/1018594-46394936.pdf?src-supplier=Element14; ComponentLink3URL: https://datasheet.ciiva.com/2453/pyu-r-int-thick-7-2453401.pdf?src-supplier=Digi-Key; ComponentLink3Description: https://datasheet.ciiva.com/2453/pyu-r-int-thick-7-2453401.pdf?src-supplier=Digi-Key; ComponentLink4URL: https://datasheet.ciiva.com/2453/pyu-r-int-thick-7-2453402.pdf?src-supplier=Digi-Key; ComponentLink4Description: https://datasheet.ciiva.com/2453/pyu-r-int-thick-7-2453402.pdf?src-supplier=Digi-Key; ComponentLink5URL: https://datasheet.ciiva.com/2453/pyu-r-int-thick-7-2453400.pdf?src-supplier=Digi-Key; ComponentLink5Description: https://datasheet.ciiva.com/2453/pyu-r-int-thick-7-2453400.pdf?src-supplier=Digi-Key; ComponentLink6URL: https://datasheet.ciiva.com/12558/pyu-rc0402-51-rohs-l-6-r-8721-12558460.pdf?src-supplier=Mouser; ComponentLink6Description: https://datasheet.ciiva.com/12558/pyu-rc0402-51-rohs-l-6-r-8721-12558460.pdf?src-supplier=Mouser; ComponentLink7URL: https://datasheet.ciiva.com/16744/pyu-rc0402-51-rohs-l-6-r-16744283.pdf?src-supplier=Future+Electronics; ComponentLink7Description: https://datasheet.ciiva.com/16744/pyu-rc0402-51-rohs-l-6-r-16744283.pdf?src-supplier=Future+Electronics; ComponentLink8URL: https://datasheet.ciiva.com/15189/getdatasheetpartid-323636-15189493.pdf?src-supplier=Verical; ComponentLink8Description: https://datasheet.ciiva.com/15189/getdatasheetpartid-323636-15189493.pdf?src-supplier=Verical; Supplier Part Number 1: RC0402FR-075K1L; LCSC Part Number: C105872
R141 = RC0402FR-070RL: RES 0 OHM JUMPER 1/16W 0402; Manufacturer: Yageo; Item Type: Resistors; Resistance: 0R; Tolerance: 1%; Power Rating: 62.5mW; Voltage Rating: 50V; Temperature Coefficient: 200ppm/°C; Max Power Dissipation: 63mW; Supplier 1: Mouser; Manufacturer Part Number: RC0402FR-070RL; RoHS: Yes; Stock 1: 8556842; Pricing 1: 1=0.10000, 10=0.01400, 50=0.01400, 100=0.00600, 1000=0.00300, 5000=0.00200, 10000=0.00100 (USD); Mount: Surface Mount; Case/Package: 0402; Contact Plating: Tin,Matte; Case Code (Imperial): 0402; Case Code (Metric): 1005; Size Code: 0402; Min Operating Temperature: -55°C; Max Operating Temperature: 155°C; Resistor Type: Thick Film; Packaging: Tape and Reel; Termination: SMD/SMT; Features: Moisture Resistant; Series: RC; Number of Terminations: 2; Length: 1mm; Width: 0.5mm; Height: 0.35mm; Radiation Hardening: No; Lead Free: Lead Free; RoHS Compliant: Yes; ComponentLink1URL: https://datasheet.ciiva.com/8896/pyu-rc0402-51-rohs-l-6-8896149.pdf?src-supplier=Avnet; ComponentLink1Description: https://datasheet.ciiva.com/8896/pyu-rc0402-51-rohs-l-6-8896149.pdf?src-supplier=Avnet; ComponentLink2URL: https://datasheet.ciiva.com/16790/pyu-rc0402-51-rohs-l-6-r-16790444.pdf?src-supplier=Future+Electronics; ComponentLink2Description: https://datasheet.ciiva.com/16790/pyu-rc0402-51-rohs-l-6-r-16790444.pdf?src-supplier=Future+Electronics; Supplier Part Number 1: 603-RC0402FR-070RL; LCSC Part Number: C106231
SW6 = B3U-1000P: SWITCH TACTILE SPST-NO 0.05A 12V; Manufacturer: Omron; Mechanical Life: 200000Cycles; Operating Force: 1.5N; Throw Configuration: SPST; Current Rating: 50mA; Contact Resistance: 100mR; Illumination Type: Non-Illuminated,Illuminated; Switch Travel: 0.15mm; Switch Function: Off-Mom; Actuator Type: Standard; Actuator Length: 0.4mm; Ratings: Dust Proof,IP40; ComponentLink1URL: http://www.farnell.com/datasheets/60838.pdf?src-supplier=Farnell; ComponentLink1Description: http://www.farnell.com/datasheets/60838.pdf?src-supplier=Farnell; ComponentLink2URL: http://www.farnell.com/datasheets/60838.pdf?src-supplier=Element14; ComponentLink2Description: http://www.farnell.com/datasheets/60838.pdf?src-supplier=Element14; ComponentLink3URL: https://omronfs.omron.com/en_US/ecb/products/pdf/en-b3u.pdf?src-supplier=Digi-Key; ComponentLink3Description: https://omronfs.omron.com/en_US/ecb/products/pdf/en-b3u.pdf?src-supplier=Digi-Key; ComponentLink4URL: http://www.omron.com/ecb/products/pdf/en-b3u.pdf?src-supplier=Digi-Key; ComponentLink4Description: http://www.omron.com/ecb/products/pdf/en-b3u.pdf?src-supplier=Digi-Key; ComponentLink5URL: https://www.distrelec.biz/Web/Downloads/he/et/B3U_eng_datasheet.pdf?mime=application%2Fpdf&src-supplier=Distrelec; ComponentLink5Description: https://www.distrelec.biz/Web/Downloads/he/et/B3U_eng_datasheet.pdf?mime=application%2Fpdf&src-supplier=Distrelec; ComponentLink6URL: http://www.onlinecomponents.com/productFiles/mf-OM/en-b3u.pdf?src-supplier=Onlinecomponents.com; ComponentLink6Description: http://www.onlinecomponents.com/productFiles/mf-OM/en-b3u.pdf?src-supplier=Onlinecomponents.com; Supplier 1: Digi-Key; Manufacturer Part Number: B3U-1000P; Stock 1: 116454; Pricing 1: 1=1, 10=0.961, 25=0.9064, 50=0.7976, 100=0.7251, 250=0.68888, 500=0.67074, 1000=0.52571 (USD); Mount: Surface Mount; Weight: 0.000776oz; Contact Material: Silver; Min Operating Temperature: -25°C; Max Operating Temperature: 70°C; Packaging: Tape and Reel; Voltage Rating (DC): 12V; Package Quantity: 1; Max Current Rating: 50mA; Termination: SMD/SMT; Orientation: Straight; Max Voltage Rating (DC): 12V; Electrical Life: 200000Cycles; Insulation Resistance: 100MR; Contact Current Rating: 50mA; Length: 4mm; Height: 1.2mm; Depth: 2.5mm; Width: 3mm; REACH SVHC: Unknown; Lead Free: Lead Free; ComponentLink7URL: https://www.verical.com/server-webapp/html/getDatasheet?partID=552554&src-supplier=Verical; ComponentLink7Description: https://www.verical.com/server-webapp/html/getDatasheet?partID=552554&src-supplier=Verical; ComponentLink8URL: http://www.farnell.com/datasheets/1685550.pdf?src-supplier=Element14; ComponentLink8Description: http://www.farnell.com/datasheets/1685550.pdf?src-supplier=Element14; ComponentLink9URL: http://www.farnell.com/datasheets/2610940.pdf?src-supplier=Farnell; ComponentLink9Description: http://www.farnell.com/datasheets/2610940.pdf?src-supplier=Farnell; ComponentLink10URL: https://www.alliedelec.com/m/d/4c8a9ef82804fc3c241a13c1e298fd73.pdf?src-supplier=Allied+Electronics; ComponentLink10Description: https://www.alliedelec.com/m/d/4c8a9ef82804fc3c241a13c1e298fd73.pdf?src-supplier=Allied+Electronics; Supplier Part Number 1: SW1020DKR-ND; LCSC Part Number: C231329; Item Type: Switch
TP11 TP12 = TEST POINT 0.5mm Dia: Test Point ON; Item Type: Test Point; Manufacturer Part Number: TEST POINT 0.5mm Dia
U16 = STM32F446VET6: IC MCU 32BIT 512KB FLASH 100LQFP; Manufacturer: STMicroelectronics; Manufacturer Part Number: STM32F446VET6; Package: LQFP (14x14); LCSC Part Number: C91929; Item Type: IC
X6 = 5TJ480000XYLBC: 8MHz 18pF ±10ppm SMD5032-4P Crystals ROHS; Manufacturer: JYJE; Manufacturer Part Number: 5TJ480000XYLBC; ComponentLink1Description: LCSC; ComponentLink1URL: https://www.lcsc.com/product-detail/Crystals_JYJE-5TJ480000XYLBC_C2149247.html; Package: SMD5032-4P; LCSC Part Number: C2149247; Item Type: Crystal

## Sheet Motor_Driver_Sheet4.SchDoc
size 420 x 297 mm; SheetNumber: 24; SheetTotal: 26
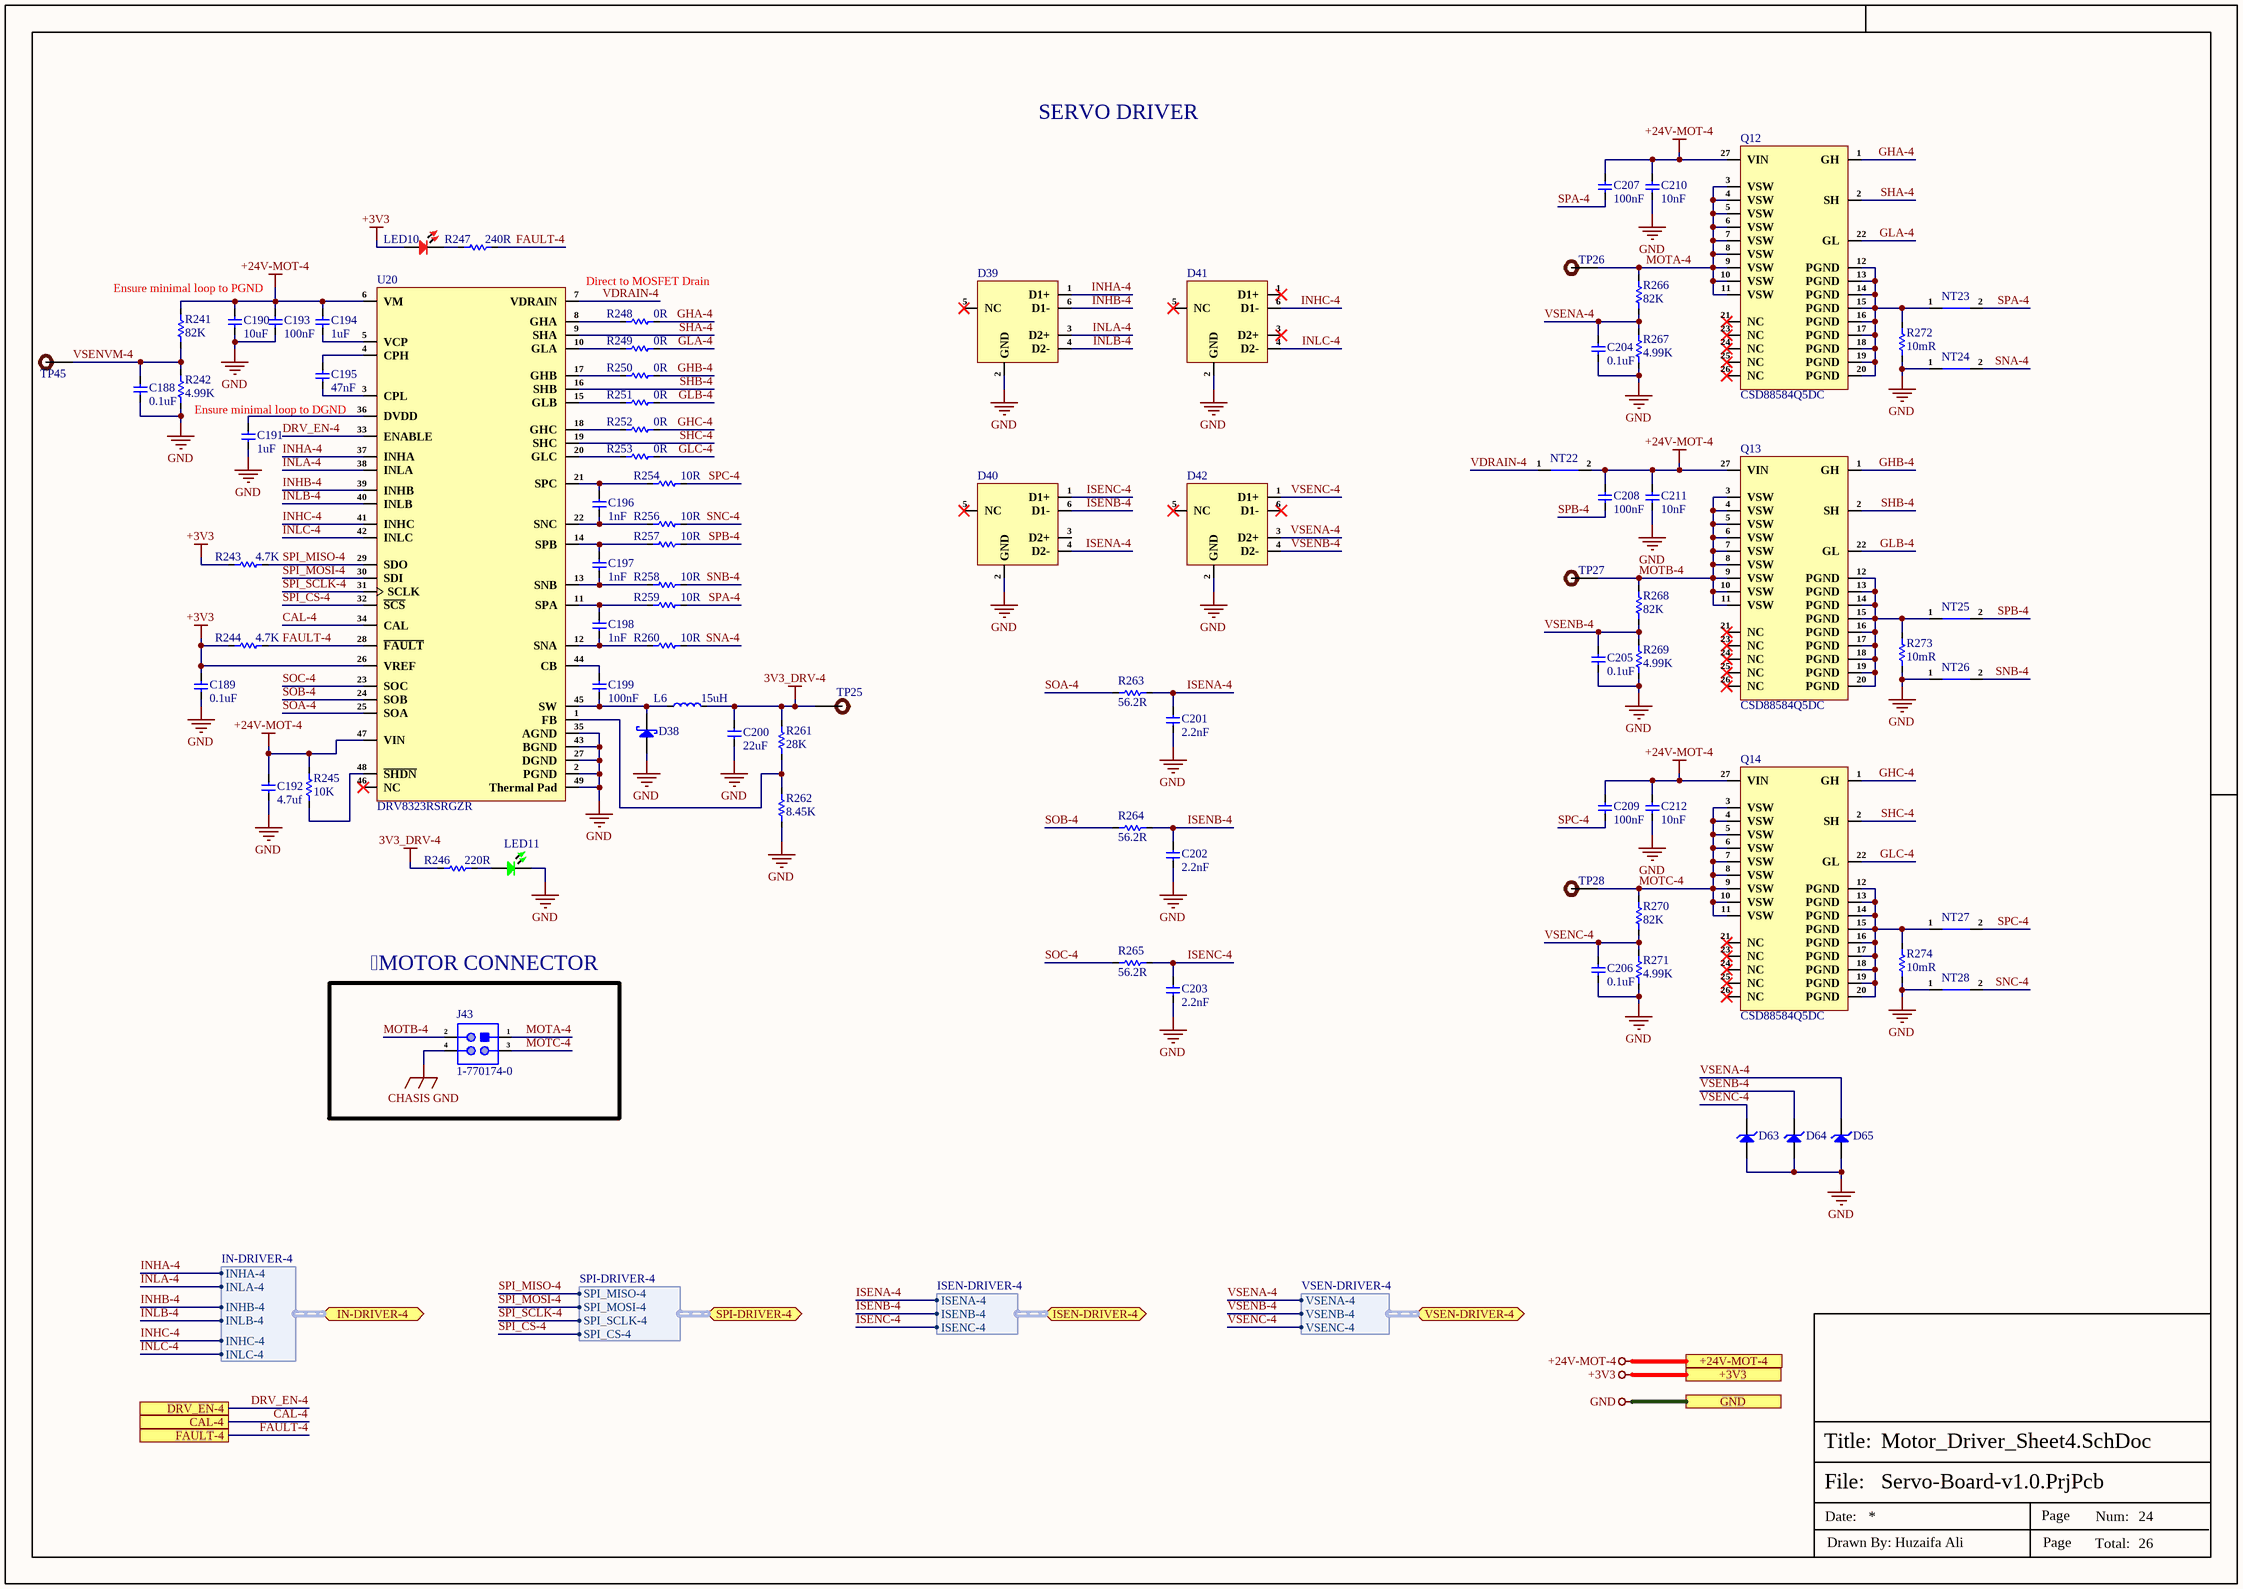
[diagram p12: Motor_Driver_Sheet4.SchDoc]

### Parts
C188  0.1uF  [Cap-0402]
C189  0.1uF  [Cap-0402]
C190  10uF  [Cap-1206]
C191  1uF  [Cap-0603]
C192  4.7uf  [Cap-0805]
C193  100nF  [Cap-0603]
C194  1uF  [Cap-0603]
C195  47nF  [Cap-0402]
C196  1nF  [Cap-0402]
C197  1nF  [Cap-0402]
C198  1nF  [Cap-0402]
C199  100nF  [Cap-0603]
C200  22uF  [Cap-0603]
C201  2.2nF  [Cap-0603]
C202  2.2nF  [Cap-0603]
C203  2.2nF  [Cap-0603]
C204  0.1uF  [Cap-0402]
C205  0.1uF  [Cap-0402]
C206  0.1uF  [Cap-0402]
C207  100nF  [Cap-0603]
C208  100nF  [Cap-0603]
C209  100nF  [Cap-0603]
C210  10nF  [Cap-0402]
C211  10nF  [Cap-0402]
C212  10nF  [Cap-0402]
D38  SS24A  [SMA]  (value not drawn)
D39  TPD4E1U06DCKR  [SOT-363]  (value not drawn)
D40  TPD4E1U06DCKR  [SOT-363]  (value not drawn)
D41  TPD4E1U06DCKR  [SOT-363]  (value not drawn)
D42  TPD4E1U06DCKR  [SOT-363]  (value not drawn)
D63  MM3Z3V3B  [SOD323F]  (value not drawn)
D64  MM3Z3V3B  [SOD323F]  (value not drawn)
D65  MM3Z3V3B  [SOD323F]  (value not drawn)
J43  1-770174-0  [1-770174-0]
L6  15uH  [FEXL0550A-150M]
LED10  RED  [LED-0603]  (value not drawn)
LED11  Emerald  [LED-0603]  (value not drawn)
NT22  Net Tie_SMD  [Net Tie Pad]  (value not drawn)  (net tie, no BOM)
NT23  Net Tie_SMD  [Net Tie Pad]  (value not drawn)  (net tie, no BOM)
NT24  Net Tie_SMD  [Net Tie Pad]  (value not drawn)  (net tie, no BOM)
NT25  Net Tie_SMD  [Net Tie Pad]  (value not drawn)  (net tie, no BOM)
NT26  Net Tie_SMD  [Net Tie Pad]  (value not drawn)  (net tie, no BOM)
NT27  Net Tie_SMD  [Net Tie Pad]  (value not drawn)  (net tie, no BOM)
NT28  Net Tie_SMD  [Net Tie Pad]  (value not drawn)  (net tie, no BOM)
Q12  CSD88584Q5DC  [22-VSON-CLIP (5x6)]
Q13  CSD88584Q5DC  [22-VSON-CLIP (5x6)]
Q14  CSD88584Q5DC  [22-VSON-CLIP (5x6)]
R241  82K  [Res-0603]
R242  4.99K  [Res-0603]
R243  4.7K  [Res-0402]
R244  4.7K  [Res-0402]
R245  10K  [Res-0402]
R246  220R  [Res-0603]
R247  240R  [Res-0402]
R248  0R  [Res-0402]
R249  0R  [Res-0402]
R250  0R  [Res-0402]
R251  0R  [Res-0402]
R252  0R  [Res-0402]
R253  0R  [Res-0402]
R254  10R  [Res-0603]
R256  10R  [Res-0603]
R257  10R  [Res-0603]
R258  10R  [Res-0603]
R259  10R  [Res-0603]
R260  10R  [Res-0603]
R261  28K  [Res-0402]
R262  8.45K  [Res-0402]
R263  56.2R  [Res-0603]
R264  56.2R  [Res-0603]
R265  56.2R  [Res-0603]
R266  82K  [Res-0603]
R267  4.99K  [Res-0603]
R268  82K  [Res-0603]
R269  4.99K  [Res-0603]
R270  82K  [Res-0603]
R271  4.99K  [Res-0603]
R272  10mR  [RES-2512]
R273  10mR  [RES-2512]
R274  10mR  [RES-2512]
TP25  TEST POINT 0.5mm Dia  [Test-point - 0.5mm]  (value not drawn)  (no BOM)
TP26  TEST POINT 0.5mm Dia  [Test-point - 0.5mm]  (value not drawn)  (no BOM)
TP27  TEST POINT 0.5mm Dia  [Test-point - 0.5mm]  (value not drawn)  (no BOM)
TP28  TEST POINT 0.5mm Dia  [Test-point - 0.5mm]  (value not drawn)  (no BOM)
TP45  TEST POINT 0.5mm Dia  [Test-point - 0.5mm]  (value not drawn)  (no BOM)
U20  DRV8323RSRGZR  [48-VQFN (7x7)]

### Ports
+3V3 (see Servo4[2B], CAN_Sheet[4D], Controller_Sheet[5D], DIO_1[5D], DIO_2[5D], DIO_3[5D], DIO_4[5D], Encoder_Sheet1[5D], Encoder_Sheet2[4D], Encoder_Sheet3[4D], Encoder_Sheet4[5D], EtherCAT_Sheet[5D], Motor_Driver_Sheet1[5D], Motor_Driver_Sheet2[5D], Motor_Driver_Sheet3[5D], Power_Sheet[5D], RS485_RS232_Sheet[5D], Sec_Controller_Sheet1[5D], Sec_Controller_Sheet2[5D], Sec_Controller_Sheet3[5D], Sec_Controller_Sheet4[5D], Servo1[5D], Servo2[5D], Servo3[5D], Servo4[5D]), +24V-MOT-4 (see Servo4[2A], Power_Sheet[5D], Servo4[5D]), CAL-4 (see Servo4[2B], Sec_Controller_Sheet4[2D]), DRV_EN-4 (see Servo4[2B], Sec_Controller_Sheet4[2D]), FAULT-4 (see Servo4[2B], Sec_Controller_Sheet4[2D]), GND (see Servo4[2B], CAN_Sheet[4D], Controller_Sheet[5D], DIO_1[5D], DIO_2[5D], DIO_3[5D], DIO_4[5D], Encoder_Sheet1[5D], Encoder_Sheet2[4D], Encoder_Sheet3[4D], Encoder_Sheet4[5D], EtherCAT_Sheet[5D], Motor_Driver_Sheet1[5D], Motor_Driver_Sheet2[5D], Motor_Driver_Sheet3[5D], Power_Sheet[5D], RS485_RS232_Sheet[5D], Sec_Controller_Sheet1[5D], Sec_Controller_Sheet2[5D], Sec_Controller_Sheet3[5D], Sec_Controller_Sheet4[5D], Servo1[5D], Servo2[5D], Servo3[5D], Servo4[5D]), IN-DRIVER-4 (bidir, harness IN-DRIVER-4, see Servo4[2B], Sec_Controller_Sheet4[2C]), ISEN-DRIVER-4 (bidir, harness ISEN-DRIVER-4, see Servo4[2B], Sec_Controller_Sheet4[2D]), SPI-DRIVER-4 (bidir, harness SPI-DRIVER-4, see Servo4[2B], Sec_Controller_Sheet4[2D]), VSEN-DRIVER-4 (bidir, harness VSEN-DRIVER-4, see Servo4[2B], Sec_Controller_Sheet4[3C])

### Harnesses
IN-DRIVER-4: INHA-4, INLA-4, INHB-4, INLB-4, INHC-4, INLC-4
SPI-DRIVER-4: SPI_MISO-4, SPI_MOSI-4, SPI_SCLK-4, SPI_CS-4
ISEN-DRIVER-4: ISENA-4, ISENB-4, ISENC-4
VSEN-DRIVER-4: VSENA-4, VSENB-4, VSENC-4

### Nets
3V3_DRV-4: C200.2 L6.2 R246.1 R261.2 TP25.1
+3V3: C189.2 LED10.1 R243.1 R244.1 U20.26(VREF) ; port +3V3
+24V-MOT-4: C190.2 C192.2 C193.2 C194.2 C207.2 C208.2 C209.2 C210.2 C211.2 C212.2 NT22.2 Q12.27(VIN) Q13.27(VIN) Q14.27(VIN) R241.2 R245.1 U20.6(VM) U20.47(VIN) ; port +24V-MOT-4
CHASIS GND: J43.4
GND: C188.1 C189.1 C190.1 C191.1 C192.1 C193.1 C200.1 C201.1 C202.1 C203.1 C204.1 C205.1 C206.1 C210.1 C211.1 C212.1 D38.2(A) D39.2(GND) D40.2(GND) D41.2(GND) D42.2(GND) D63.1(A) D64.1(A) D65.1(A) LED11.2 NT24.1 NT26.1 NT28.1 R242.1 R262.1 R267.1 R269.1 R271.1 R272.1 R273.1 R274.1 U20.2(PGND) U20.27(DGND) U20.35(AGND) U20.43(BGND) U20.49(Thermal_Pad) ; port GND
CAL-4: U20.34(CAL) ; port CAL-4
DRV_EN-4: U20.33(ENABLE) ; port DRV_EN-4
FAULT-4: R244.2 R247.2 U20.28(~{FAULT}) ; port FAULT-4
GHA-4: Q12.1(GH) R248.2
GHB-4: Q13.1(GH) R250.2
GHC-4: Q14.1(GH) R252.2
GLA-4: Q12.22(GL) R249.2
GLB-4: Q13.22(GL) R251.2
GLC-4: Q14.22(GL) R253.2
INHA-4: D39.1(D1+) U20.37(INHA) ; port IN-DRIVER-4.INHA-4
INHB-4: D39.6(D1-) U20.39(INHB) ; port IN-DRIVER-4.INHB-4
INHC-4: D41.6(D1-) U20.41(INHC) ; port IN-DRIVER-4.INHC-4
INLA-4: D39.3(D2+) U20.38(INLA) ; port IN-DRIVER-4.INLA-4
INLB-4: D39.4(D2-) U20.40(INLB) ; port IN-DRIVER-4.INLB-4
INLC-4: D41.4(D2-) U20.42(INLC) ; port IN-DRIVER-4.INLC-4
ISENA-4: C201.2 D40.4(D2-) R263.2 ; port ISEN-DRIVER-4.ISENA-4
ISENB-4: C202.2 D40.6(D1-) R264.2 ; port ISEN-DRIVER-4.ISENB-4
ISENC-4: C203.2 D40.1(D1+) R265.2 ; port ISEN-DRIVER-4.ISENC-4
MOTA-4: J43.1 Q12.3(VSW) Q12.4(VSW) Q12.5(VSW) Q12.6(VSW) Q12.7(VSW) Q12.8(VSW) Q12.9(VSW) Q12.10(VSW) Q12.11(VSW) R266.2 TP26.1
MOTB-4: J43.2 Q13.3(VSW) Q13.4(VSW) Q13.5(VSW) Q13.6(VSW) Q13.7(VSW) Q13.8(VSW) Q13.9(VSW) Q13.10(VSW) Q13.11(VSW) R268.2 TP27.1
MOTC-4: J43.3 Q14.3(VSW) Q14.4(VSW) Q14.5(VSW) Q14.6(VSW) Q14.7(VSW) Q14.8(VSW) Q14.9(VSW) Q14.10(VSW) Q14.11(VSW) R270.2 TP28.1
SHA-4: Q12.2(SH) U20.9(SHA)
SHB-4: Q13.2(SH) U20.16(SHB)
SHC-4: Q14.2(SH) U20.19(SHC)
SNA-4: NT24.2 R260.2
SNB-4: NT26.2 R258.2
SNC-4: NT28.2 R256.2
SOA-4: R263.1 U20.25(SOA)
SOB-4: R264.1 U20.24(SOB)
SOC-4: R265.1 U20.23(SOC)
SPA-4: C207.1 NT23.2 R259.2
SPB-4: C208.1 NT25.2 R257.2
SPC-4: C209.1 NT27.2 R254.2
SPI_CS-4: U20.32(~{SCS}) ; port SPI-DRIVER-4.SPI_CS-4
SPI_MISO-4: R243.2 U20.29(SDO) ; port SPI-DRIVER-4.SPI_MISO-4
SPI_MOSI-4: U20.30(SDI) ; port SPI-DRIVER-4.SPI_MOSI-4
SPI_SCLK-4: U20.31(SCLK) ; port SPI-DRIVER-4.SPI_SCLK-4
VDRAIN-4: NT22.1 U20.7(VDRAIN)
VSENA-4: C204.2 D42.3(D2+) D65.2(K) R266.1 R267.2 ; port VSEN-DRIVER-4.VSENA-4
VSENB-4: C205.2 D42.4(D2-) D64.2(K) R268.1 R269.2 ; port VSEN-DRIVER-4.VSENB-4
VSENC-4: C206.2 D42.1(D1+) D63.2(K) R270.1 R271.2 ; port VSEN-DRIVER-4.VSENC-4
VSENVM-4: C188.2 R241.1 R242.2 TP45.1
NetC191_2: C191.2 U20.36(DVDD)
NetC194_1: C194.1 U20.5(VCP)
NetC195_1: C195.1 U20.3(CPL)
NetC195_2: C195.2 U20.4(CPH)
NetC196_1: C196.1 R256.1 U20.22(SNC)
NetC196_2: C196.2 R254.1 U20.21(SPC)
NetC197_1: C197.1 R258.1 U20.13(SNB)
NetC197_2: C197.2 R257.1 U20.14(SPB)
NetC198_1: C198.1 R260.1 U20.12(SNA)
NetC198_2: C198.2 R259.1 U20.11(SPA)
NetC199_1: C199.1 D38.1(K) L6.1 U20.45(SW)
NetC199_2: C199.2 U20.44(CB)
NetLED10_2: LED10.2 R247.1
NetLED11_1: LED11.1 R246.2
NetNT23_1: NT23.1 Q12.12(PGND) Q12.13(PGND) Q12.14(PGND) Q12.15(PGND) Q12.16(PGND) Q12.17(PGND) Q12.18(PGND) Q12.19(PGND) Q12.20(PGND) R272.2
NetNT25_1: NT25.1 Q13.12(PGND) Q13.13(PGND) Q13.14(PGND) Q13.15(PGND) Q13.16(PGND) Q13.17(PGND) Q13.18(PGND) Q13.19(PGND) Q13.20(PGND) R273.2
NetNT27_1: NT27.1 Q14.12(PGND) Q14.13(PGND) Q14.14(PGND) Q14.15(PGND) Q14.16(PGND) Q14.17(PGND) Q14.18(PGND) Q14.19(PGND) Q14.20(PGND) R274.2
NetR245_2: R245.2 U20.48(~{SHDN})
NetR248_1: R248.1 U20.8(GHA)
NetR249_1: R249.1 U20.10(GLA)
NetR250_1: R250.1 U20.17(GHB)
NetR251_1: R251.1 U20.15(GLB)
NetR252_1: R252.1 U20.18(GHC)
NetR253_1: R253.1 U20.20(GLC)
NetR261_1: R261.1 R262.2 U20.1(FB)

Not connected (* = marked no-connect by the designer): D39 5(NC)*; D40 3(D2+) 5(NC)*; D41 1(D1+)* 3(D2+)* 5(NC)*; D42 5(NC)* 6(D1-)*; Q12 21(NC)* 23(NC)* 24(NC)* 25(NC)* 26(NC)*; Q13 21(NC)* 23(NC)* 24(NC)* 25(NC)* 26(NC)*; Q14 21(NC)* 23(NC)* 24(NC)* 25(NC)* 26(NC)*; U20 46(NC)*

### Notes on the sheet
- SERVO DRIVER
- Ensure minimal loop to PGND
- Direct to MOSFET Drain
- Ensure minimal loop to DGND
- MOTOR CONNECTOR
- File:
- Title:
- Date:
- Page
- Num:
- Total:
- Drawn By: Huzaifa Ali